# Altium schematic sheet Top.SchDoc
size B
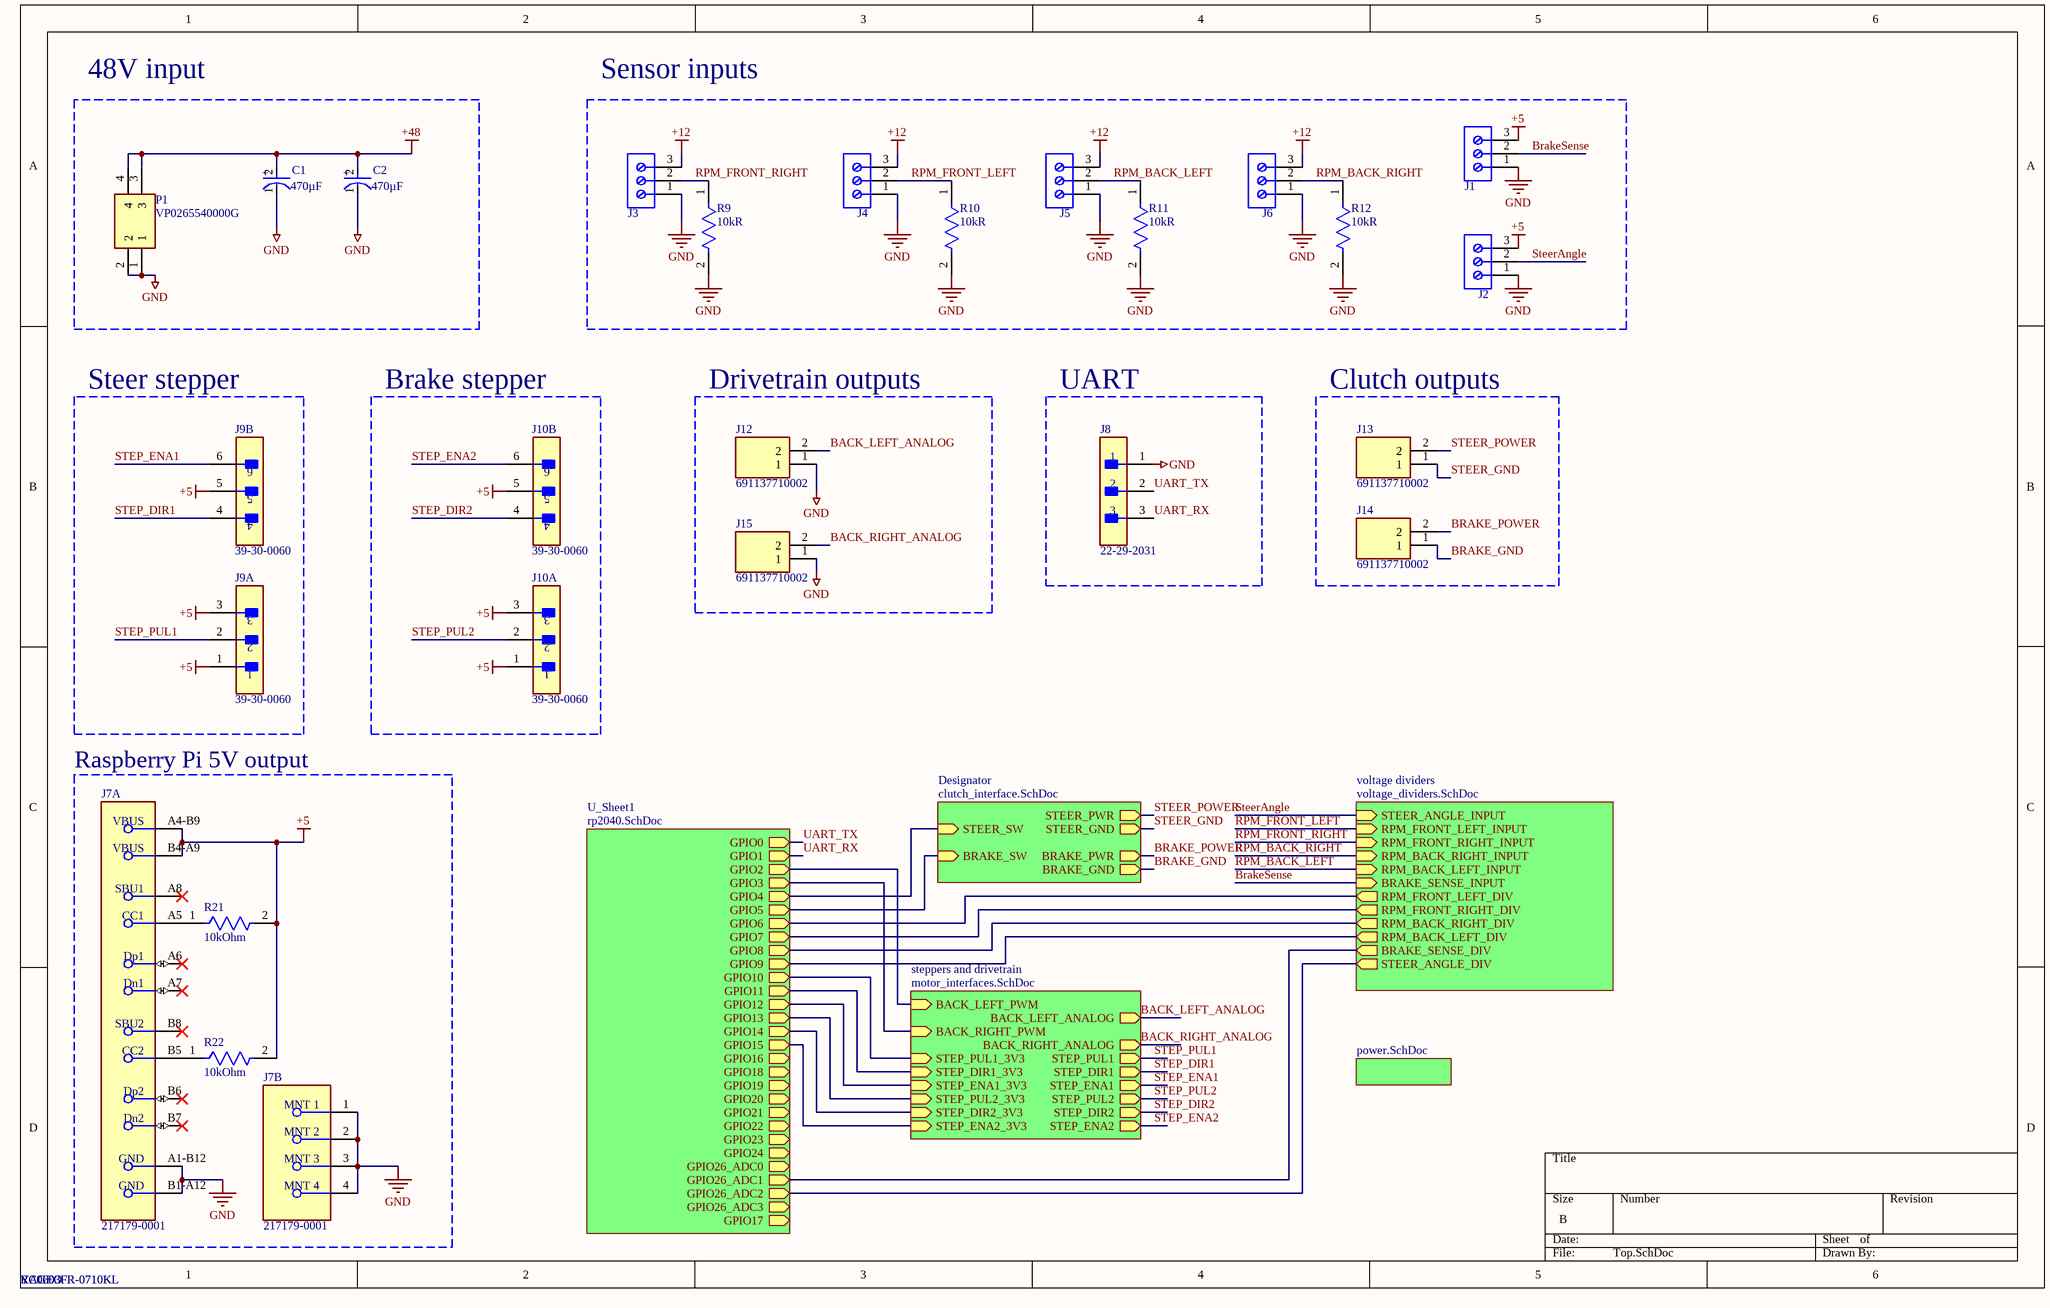
[diagram p0: Top.SchDoc]

## Parts
C1  Capacitance: 470µF  [FP-ESH477M100AM2AA-MFG]  (hidden comment: ESH477M100AM2AA)
C2  Capacitance: 470µF  [FP-ESH477M100AM2AA-MFG]  (hidden comment: ESH477M100AM2AA)
J1  691137710003  [691137710003]  (value not drawn)
J2  691137710003  [691137710003]  (value not drawn)
J3  691137710003  [691137710003]  (value not drawn)
J4  691137710003  [691137710003]  (value not drawn)
J5  691137710003  [691137710003]  (value not drawn)
J6  691137710003  [691137710003]  (value not drawn)
J7  217179-0001  [FP-2171790001-MFG]  (parts A,B of 2)
J8  22-29-2031  [FP-22-29-2031-MFG]
J9  39-30-0060  [FP-39-30-0060-MFG]  (parts A,B of 2)
J10  39-30-0060  [FP-39-30-0060-MFG]  (parts A,B of 2)
J12  691137710002  [SHDR2W70P0X500_1X2_1000X750X1150P]
J13  691137710002  [SHDR2W70P0X500_1X2_1000X750X1150P]
J14  691137710002  [SHDR2W70P0X500_1X2_1000X750X1150P]
J15  691137710002  [SHDR2W70P0X500_1X2_1000X750X1150P]
P1  VP0265540000G  [VP0265540000G]
R9  Resistance: 10kR  [FP-ERA3A-IPC_C]  (hidden comment: ERA-3AEB103V)
R10  Resistance: 10kR  [FP-ERA3A-IPC_C]  (hidden comment: ERA-3AEB103V)
R11  Resistance: 10kR  [FP-ERA3A-IPC_C]  (hidden comment: ERA-3AEB103V)
R12  Resistance: 10kR  [FP-ERA3A-IPC_C]  (hidden comment: ERA-3AEB103V)
R21  10kOhm  Manufacturer: YAGEO  Manufacturer Part Number: RC0603FR-0710KL  [FP-MCT0603-IPC_B]
R22  10kOhm  Manufacturer: YAGEO  Manufacturer Part Number: RC0603FR-0710KL  [FP-MCT0603-IPC_B]

## Blocks framed on the sheet
48V input: C1 C2 P1
Sensor inputs: J1-J6 R9-R12
Steer stepper: J9
Brake stepper: J10
Drivetrain outputs: J12 J15
UART: J8
Clutch outputs: J13 J14
Raspberry Pi 5V output: J7 R21 R22

## Sub-sheets
Designator = clutch_interface.SchDoc: STEER_SW (in), BRAKE_SW (in), STEER_PWR (out), STEER_GND (out), BRAKE_PWR (out), BRAKE_GND (out)
steppers and drivetrain = motor_interfaces.SchDoc: STEP_PUL1_3V3 (in), STEP_DIR1_3V3 (in), STEP_ENA1_3V3 (in), STEP_PUL2_3V3 (in), STEP_DIR2_3V3 (in), STEP_ENA2_3V3 (in), STEP_ENA1 (out), STEP_DIR1 (out), STEP_PUL1 (out), STEP_PUL2 (out), STEP_DIR2 (out), STEP_ENA2 (out), BACK_LEFT_PWM (in), BACK_RIGHT_PWM (in), BACK_LEFT_ANALOG (out), BACK_RIGHT_ANALOG (out)
U_Sheet1 = rp2040.SchDoc: GPIO0 (out), GPIO1 (out), GPIO2 (out), GPIO3 (out), GPIO4 (out), GPIO5 (out), GPIO6 (out), GPIO7 (out), GPIO8 (out), GPIO9 (out), GPIO10 (out), GPIO11 (out), GPIO12 (out), GPIO13 (out), GPIO14 (out), GPIO15 (out), GPIO16 (out), GPIO18 (out), GPIO19 (out), GPIO20 (out), GPIO21 (out), GPIO22 (out), GPIO23 (out), GPIO24 (out), GPIO26_ADC0 (out), GPIO26_ADC1 (out), GPIO26_ADC2 (out), GPIO26_ADC3 (out), GPIO17 (out)
voltage dividers = voltage_dividers.SchDoc: RPM_FRONT_LEFT_INPUT (in), RPM_FRONT_RIGHT_INPUT (in), RPM_BACK_RIGHT_INPUT (in), RPM_BACK_LEFT_INPUT (in), BRAKE_SENSE_INPUT (in), RPM_FRONT_LEFT_DIV (out), RPM_FRONT_RIGHT_DIV (out), RPM_BACK_RIGHT_DIV (out), RPM_BACK_LEFT_DIV (out), BRAKE_SENSE_DIV (out), STEER_ANGLE_DIV (out), STEER_ANGLE_INPUT (in)
? = power.SchDoc: no entries

## Nets
+5: J1.3 J2.3 J7.A4-B9(VBUS) J7.B4-A9(VBUS) J9.1 J9.3 J9.5 J10.1 J10.3 J10.5 R21.2 R22.2
+12: J3.3 J4.3 J5.3 J6.3
+48: C1.2(A) C2.2(A) P1.3 P1.4
GND: C1.1(C) C2.1(C) J1.1 J2.1 J3.1 J4.1 J5.1 J6.1 J7.1(MNT_1) J7.2(MNT_2) J7.3(MNT_3) J7.4(MNT_4) J7.A1-B12(GND) J7.B1-A12(GND) J8.1 J12.1 J15.1 P1.1 P1.2 R9.2 R10.2 R11.2 R12.2
BACK_LEFT_ANALOG: J12.2 ; sheet steppers and drivetrain/BACK_LEFT_ANALOG
BACK_RIGHT_ANALOG: J15.2 ; sheet steppers and drivetrain/BACK_RIGHT_ANALOG
BRAKE_GND: J14.1 ; sheet Designator/BRAKE_GND
BRAKE_POWER: J14.2 ; sheet Designator/BRAKE_PWR
BrakeSense: J1.2 ; sheet voltage dividers/BRAKE_SENSE_INPUT
RPM_BACK_LEFT: J5.2 R11.1 ; sheet voltage dividers/RPM_BACK_LEFT_INPUT
RPM_BACK_RIGHT: J6.2 R12.1 ; sheet voltage dividers/RPM_BACK_RIGHT_INPUT
RPM_FRONT_LEFT: J4.2 R10.1 ; sheet voltage dividers/RPM_FRONT_LEFT_INPUT
RPM_FRONT_RIGHT: J3.2 R9.1 ; sheet voltage dividers/RPM_FRONT_RIGHT_INPUT
STEER_GND: J13.1 ; sheet Designator/STEER_GND
STEER_POWER: J13.2 ; sheet Designator/STEER_PWR
SteerAngle: J2.2 ; sheet voltage dividers/STEER_ANGLE_INPUT
STEP_DIR1: J9.4 ; sheet steppers and drivetrain/STEP_DIR1
STEP_DIR2: J10.4 ; sheet steppers and drivetrain/STEP_DIR2
STEP_ENA1: J9.6 ; sheet steppers and drivetrain/STEP_ENA1
STEP_ENA2: J10.6 ; sheet steppers and drivetrain/STEP_ENA2
STEP_PUL1: J9.2 ; sheet steppers and drivetrain/STEP_PUL1
STEP_PUL2: J10.2 ; sheet steppers and drivetrain/STEP_PUL2
UART_RX: J8.3 ; sheet U_Sheet1/GPIO1
UART_TX: J8.2 ; sheet U_Sheet1/GPIO0
NetJ7_A5: J7.A5(CC1) R21.1
NetJ7_B5: J7.B5(CC2) R22.1
(unnamed): sheet U_Sheet1/GPIO2, sheet steppers and drivetrain/BACK_LEFT_PWM
(unnamed): sheet U_Sheet1/GPIO3, sheet steppers and drivetrain/BACK_RIGHT_PWM
(unnamed): sheet U_Sheet1/GPIO4, sheet Designator/STEER_SW
(unnamed): sheet U_Sheet1/GPIO5, sheet Designator/BRAKE_SW
(unnamed): sheet U_Sheet1/GPIO6, sheet voltage dividers/RPM_FRONT_LEFT_DIV
(unnamed): sheet U_Sheet1/GPIO7, sheet voltage dividers/RPM_FRONT_RIGHT_DIV
(unnamed): sheet U_Sheet1/GPIO8, sheet voltage dividers/RPM_BACK_RIGHT_DIV
(unnamed): sheet U_Sheet1/GPIO9, sheet voltage dividers/RPM_BACK_LEFT_DIV
(unnamed): sheet U_Sheet1/GPIO10, sheet steppers and drivetrain/STEP_PUL1_3V3
(unnamed): sheet U_Sheet1/GPIO11, sheet steppers and drivetrain/STEP_DIR1_3V3
(unnamed): sheet U_Sheet1/GPIO12, sheet steppers and drivetrain/STEP_ENA1_3V3
(unnamed): sheet U_Sheet1/GPIO13, sheet steppers and drivetrain/STEP_PUL2_3V3
(unnamed): sheet U_Sheet1/GPIO14, sheet steppers and drivetrain/STEP_DIR2_3V3
(unnamed): sheet U_Sheet1/GPIO15, sheet steppers and drivetrain/STEP_ENA2_3V3
(unnamed): sheet U_Sheet1/GPIO26_ADC1, sheet voltage dividers/BRAKE_SENSE_DIV
(unnamed): sheet U_Sheet1/GPIO26_ADC2, sheet voltage dividers/STEER_ANGLE_DIV

Not connected (* = marked no-connect by the designer): J7 A6(Dp1)* A7(Dn1)* A8(SBU1)* B6(Dp2)* B7(Dn2)* B8(SBU2)*

## Notes on the sheet
- (in symbol CMP-00212-26722299-1) +

## Library data of the parts
C1 C2 = CMP-00212-26722299-1: ESH477M100AM2AA Radial Can ALUMINUM ELECTROLYTIC CAPACITOR ESH 100V 470muF ±20% 0.630Dia 16.00mm; Life (Hours): 2000hours; Case/Package: Radial; Height: 32mm; REACH SVHC: No SVHC; Voltage Rating: 100V; Min Operating Temperature: -25°C; Diameter: 16mm; Voltage Rating (DC): 100V; Max Operating Temperature: 105°C; RoHS: Compliant; Packaging: Tape & Reel; Tolerance: 20%; Lead Pitch: 7.5mm; NexarPartId: 26722299
J1-J6 = CMP-1502-03325-3: Terminal Block, 5MM Pitch, Horizontal, Pressure Clamp Glow Wire, Pcb, 3PINS, Gr; RoHS: Non-Compliant; Number of Pins: 3; Lead Pitch: 5mm; Packaging: Box
J7 = CMP-04767-000028-2: CONN RCP USB2.0 TYP C 24P SMD RA; NexarPartId: 117190526; Gender: Receptacle; Number of Contacts: 16; Current Rating: 1.25A; Voltage Rating: 30V; Min Operating Temperature: -40°C; USB Standard: USB 2.0; Height: 3.36mm; Contact Material: Gold, Nickel; Max Operating Temperature: 85°C
J8 = CMP-04776-000327-1: CONN HEADER VERT 3POS 2.54MM; Contact Resistance: 10mR; Number of Positions: 3; Voltage Rating: 250V; Gender: Male; Connector Type: Male Pin; Current Rating: 4A; Packaging: Bulk; Housing Material: Nylon; Min Operating Temperature: 0°C; Color: Natural; RoHS Compliant: Yes; Housing Color: White; Number of Rows: 1; Pitch: 2.54mm; Mount: Through Hole; Fastening Type: Friction; Length: 7.62mm; Depth: 5.8mm; Contact Material: Brass; Max Operating Temperature: 75°C; Number of Contacts: 3; Contact Type: Male Pin; Working Voltage: 250V; Orientation: Straight; Lead Pitch: 2.54mm; Radiation Hardening: No; Termination: Solder; Contact Plating: Gold; Contact Mating Length: 0.295inch; Series: KK® 6410
J9 J10 = CMP-04776-000273-1: CONN HEADER R/A 6POS 4.2MM; Manufacturer Series: 5569; MIL Conformance: No; Mating Information: MULTIPLE MATING PARTS AVAILABLE; Number of Contacts: 6; Voltage Rating: 600V; Gender: Male; Insulation Resistance: 1GR; Option: General Purpose; Row Spacing: 0.165inch; Contact Resistance: 10mR; Current Rating: 13A; Glow Wire Compliant: Non-compliant; Number of Ports: 1; Flammability Rating: UL94 V-0; Number of Rows: 2; Series: Mini-Fit® Jr™ 5569; Housing Color: Natural; Filter Feature: No; Contact Gender: Male; Material: Nylon; Packaging: Bag; Radiation Hardening: No; Shell Material: POLYAMIDE66; Max Operating Temperature: 105°C; Voltage Rating (DC): 600V; Contact Type: Male Pin; Min Operating Temperature: -40°C; Contact Finish - Mating: TIN (200) OVER COPPER; DIN Conformance: No; Lead Free: Lead Free; Mixed Contacts: No; Empty Shell: No; Pitch: 4.2mm; Max Voltage Rating (AC): 600V; IEC Conformance: No; Termination: Solder; Contact Plating: Tin; Orientation: Right Angle; Halogen Free: Low Halogen; Number of Positions: 6; Housing Material: Polyamide; Depth: 19.4mm; Number of Circuits: 6; Fastening Type: Ramp; Contact Finish - Termination: TIN (200) OVER COPPER; ELV: Compliant; Mount: Through Hole; Contact Material: Brass
J12-J15 = 691137710002: Connector; Manufacturer_Name: Wurth Elektronik; Datasheet Link: https://www.we-online.com/components/products/download/691137710002+%28rev1%29.pdf; Height: 11.5mm; Manufacturer_Part_Number: 691137710002; Mouser Part Number: 710-691137710002; Mouser Price/Stock: https://www.mouser.co.uk/ProductDetail/Wurth-Elektronik/691137710002?qs=lBTPRtX1sU9LnHBbviNKGA%3D%3D
P1 = VP0265540000G: Connector; Manufacturer_Name: Amphenol; Datasheet Link: http://www.anytek.com.tw/Upload/8VP0003-09242723142.pdf; Height: 28.8mm; Manufacturer_Part_Number: VP0265540000G; Mouser Part Number: 649-VP02655400J0G; Mouser Price/Stock: https://www.mouser.co.uk/ProductDetail/Amphenol-Anytek/VP0265540000G?qs=Mv7BduZupUhE8TXEOgWbFQ%3D%3D; Arrow Part Number: VP0265540000G; Arrow Price/Stock: null?region=nac
R9-R12 = CMP-2000-00874-2: RES SMD 10K OHM 0.1% 1/10W 0603; Voltage Rating (DC): 75V; Power Rating: 100mW; Temperature Coefficient: 25ppm/°C; Radiation Hardening: No; Width: 0.8mm; Depth: 0.8mm; Construction: Rectangular; Case Code (Metric): 1608; Package Quantity: 5000; Length: 1.6mm; Size Code: 0603; Case Code (Imperial): 0603; Termination: SMD/SMT; Contact Plating: Tin; Resistance Tolerance: 0.1%; Military Standard: Not; Packaging: Tape and Reel; Max Power Dissipation: 100mW; REACH SVHC: No SVHC; Series: ERA-3A; Voltage Rating: 75V; Lead Free: Lead Free; Technology: METAL FILM; RoHS Compliant: Yes; Max Operating Temperature: 155°C; Resistor Type: Thin Film; Min Operating Temperature: -55°C; Number of Pins: 2; Case/Package: 0603; Tolerance: 0.1%; Height: 0.45mm; Mount: Surface Mount; Number of Terminations: 2
R21 R22 = CMP-02407-001424-1: RES SMD 100 OHM 1% 1/8W 0603; Tolerance: 0.1%; Temperature Coefficient: 25ppm/°C; Resistance: 10kR; Max Power Dissipation: 100mW; Features: Automotive AEC-Q200; Packaging: Tape and Reel; Number of Terminations: 2; Min Operating Temperature: -55°C; Case Code (Metric): 1608; Case Code (Imperial): 0603; Case/Package: 0603; Composition: Thin Film; Max Operating Temperature: 125°C